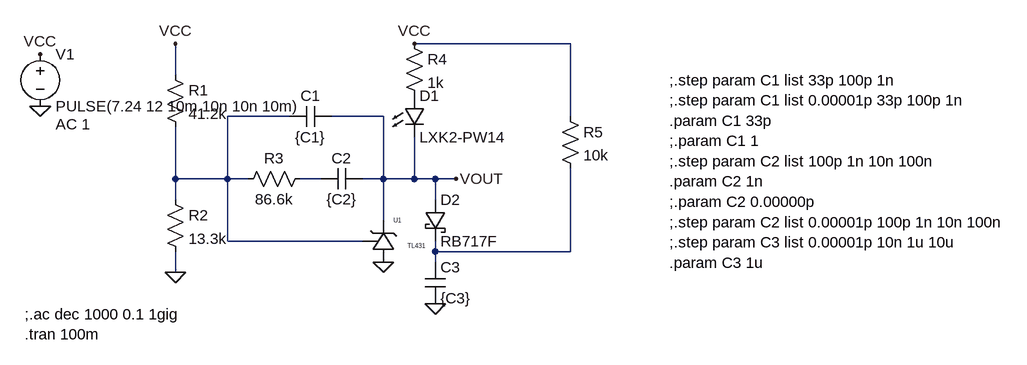
[diagram p0: schematic tl431_filter.asc]
tl431_filter.asc, the LTspice schematic file:
Version 4
SHEET 1 1388 680
WIRE 704 0 464 0
WIRE 96 48 96 0
WIRE 272 112 176 112
WIRE 416 112 336 112
WIRE 704 112 704 0
WIRE 96 208 96 128
WIRE 176 208 176 112
WIRE 176 208 96 208
WIRE 208 208 176 208
WIRE 320 208 288 208
WIRE 416 208 416 112
WIRE 416 208 384 208
WIRE 464 208 464 144
WIRE 464 208 416 208
WIRE 496 208 464 208
WIRE 528 208 496 208
WIRE 96 240 96 208
WIRE 496 240 496 208
WIRE 416 272 416 208
WIRE 176 304 176 208
WIRE 384 304 176 304
WIRE 496 320 496 304
WIRE 704 320 704 192
WIRE 704 320 496 320
WIRE 496 336 496 320
WIRE 96 352 96 320
FLAG -112 96 0
FLAG -112 16 VCC
FLAG 96 0 VCC
FLAG 96 352 0
FLAG 528 208 VOUT
FLAG 416 336 0
FLAG 464 0 VCC
FLAG 496 400 0
SYMBOL res 80 32 R0
SYMATTR InstName R1
SYMATTR Value 41.2k
SYMBOL res 80 224 R0
SYMATTR InstName R2
SYMATTR Value 13.3k
SYMBOL res 304 192 R90
WINDOW 0 0 56 VBottom 2
WINDOW 3 32 56 VTop 2
SYMATTR InstName R3
SYMATTR Value 86.6k
SYMBOL cap 336 96 R90
WINDOW 0 0 32 VBottom 2
WINDOW 3 32 32 VTop 2
SYMATTR InstName C1
SYMATTR Value {C1}
SYMBOL cap 384 192 R90
WINDOW 0 0 32 VBottom 2
WINDOW 3 32 32 VTop 2
SYMATTR InstName C2
SYMATTR Value {C2}
SYMBOL voltage -112 0 R0
WINDOW 123 24 124 Left 2
WINDOW 39 0 0 Left 0
SYMATTR Value2 AC 1
SYMATTR InstName V1
SYMATTR Value PULSE(7.24 12 10m 10n 10n 10m)
SYMBOL TL431 400 272 R0
SYMATTR InstName U1
SYMBOL res 448 -16 R0
SYMATTR InstName R4
SYMATTR Value 1k
SYMBOL LED 448 80 R0
SYMATTR InstName D1
SYMATTR Value LXK2-PW14
SYMATTR Description Diode
SYMATTR Type diode
SYMBOL schottky 480 240 R0
SYMATTR InstName D2
SYMATTR Value RB717F
SYMATTR Description Diode
SYMATTR Type diode
SYMBOL cap 480 336 R0
SYMATTR InstName C3
SYMATTR Value {C3}
SYMBOL res 688 96 R0
SYMATTR InstName R5
SYMATTR Value 10k
TEXT -136 416 Left 2 !;.ac dec 1000 0.1 1gig\n.tran 100m
TEXT 856 56 Left 2 !;.step param C1 list 33p 100p 1n\n;.step param C1 list 0.00001p 33p 100p 1n\n.param C1 33p\n;.param C1 1\n;.step param C2 list 100p 1n 10n 100n\n.param C2 1n\n;.param C2 0.00000p\n;.step param C2 list 0.00001p 100p 1n 10n 100n\n;.step param C3 list 0.00001p 10n 1u 10u\n.param C3 1u

The netlist it stands for:
* tl431_filter.asc
R1 VCC N001 41.2k
R2 N001 0 13.3k
R3 N002 N001 86.6k
C1 VOUT N001 {C1}
C2 VOUT N002 {C2}
V1 VCC 0 PULSE(7.24 12 10m 10n 10n 10m) AC 1
XU1 0 VOUT N001 TL431  ; pins A K R
R4 VCC P001 1k
D1 P001 VOUT LXK2-PW14
D2 VOUT N003 RB717F
C3 N003 0 {C3}
R5 VCC N003 10k
.model D D
.lib standard.dio
;.ac dec 1000 0.1 1gig
.tran 100m
;.step param C1 list 33p 100p 1n
;.step param C1 list 0.00001p 33p 100p 1n
.param C1 33p
;.param C1 1
;.step param C2 list 100p 1n 10n 100n
.param C2 1n
;.param C2 0.00000p
;.step param C2 list 0.00001p 100p 1n 10n 100n
;.step param C3 list 0.00001p 10n 1u 10u
.param C3 1u
.lib TL431.lib
.backanno
.end